# Altium schematic sheet Battery_Charger.SchDoc: Battery Charger
size Tabloid; Author: Adam Turaj; SheetNumber: 2; SheetTotal: 6
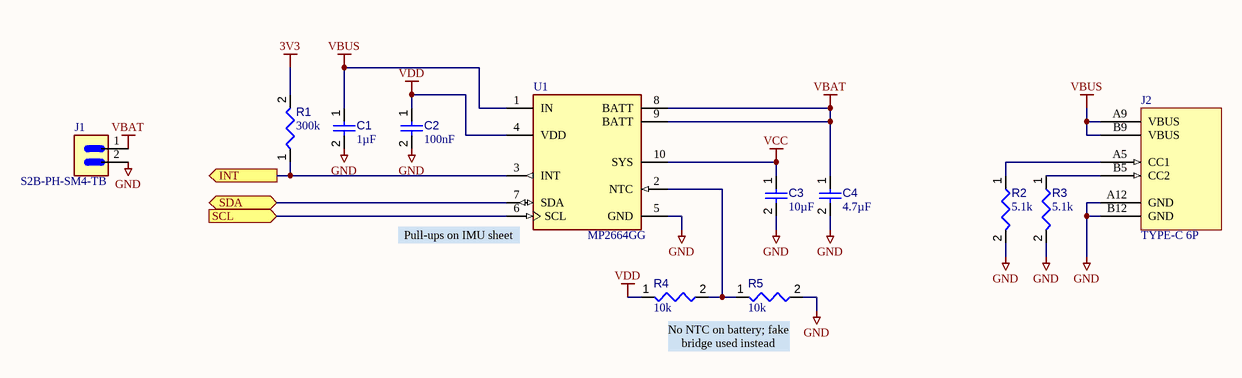
[diagram p0: Battery_Charger.SchDoc]

## Parts
C1  value 1µF  [CAPC0603(1608)100_L]  (hidden comment: Capacitor 1µF +/-40% 50V 0603)
C2  value 100nF  [CAPC1608X90X40NL10T20]  (hidden comment: Capacitor 100 nF +/-10% 50 V 0603)
C3  value 10µF  [CAPC0603(1608)100_L]  (hidden comment: Capacitor 10µF +/-20% 10V 0603)
C4  value 4.7µF  [CAPC0603(1608)100_L]  (hidden comment: Capacitor 4.7µF +/-20% 10V 0603)
J1  S2B-PH-SM4-TB  [JST_S2B-PH-SM4-TB]
J2  TYPE-C 6P  [TYPE-C 8P-Footprint-1]
R1  value 300k  [RESC1608X55X25ML10T15]  (hidden comment: Resistor 300k +/-1% 0603 100 mW)
R2  value 5.1k  [RESC1608X55X25ML10T15]  (hidden comment: Resistor 5k1 +/-1% 0603 100 mW)
R3  value 5.1k  [RESC1608X55X25ML10T15]  (hidden comment: Resistor 5k1 +/-1% 0603 100 mW)
R4  value 10k  [RESC1608X55X25ML10T15]  (hidden comment: Resistor 10k +/-1% 0603 100 mW)
R5  value 10k  [RESC1608X55X25ML10T15]  (hidden comment: Resistor 10k +/-1% 0603 100 mW)
U1  MP2664GG  [QFN50P200X200X100-10N]

## Ports
INT (out, see Root[4C]), SCL (in, see Root[4C], Display[4B], IMU[4B], MCU[5B]), SDA (bidir, see Root[4C], Display[4B], IMU[4B], MCU[5B])

## Nets
3V3: R1.2
GND: C1.2 C2.2 C3.2 C4.2 J1.2 J2.A12(GND) J2.B12(GND) R2.2 R3.2 R5.2 U1.5(GND)
VBAT: C4.1 J1.1 U1.8(BATT) U1.9(BATT)
VBUS: C1.1 J2.A9(VBUS) J2.B9(VBUS) U1.1(IN)
VCC: C3.1 U1.10(SYS)
VDD: C2.1 R4.1 U1.4(VDD)
INT: R1.1 U1.3(INT) ; port INT
SCL: U1.6(SCL) ; port SCL
SDA: U1.7(SDA) ; port SDA
NetJ2_A5: J2.A5(CC1) R2.1
NetJ2_B5: J2.B5(CC2) R3.1
NetR4_2: R4.2 R5.1 U1.2(NTC)

## Notes on the sheet
- (near U1) Pull-ups on IMU sheet
- No NTC on battery; fake bridge used instead
- Title:
- Author:
- Size:
- Date:
- Git Hash:
- Tabloid
- Prj:
- Variant:
- Edited:
- File:

## Library data of the parts
C1 = CMP-001-00078-4: Chip Capacitor, 1µF +/-40%, 50V, 0603, Thickness 1 mm; Tolerance: 10%; Case/Package: 0603; Pins: 2; Max Operating Temperature: 85°C; Voltage Rating: 50V; Mounting Technology: SMT; Min Operating Temperature: -55°C
C2 = CMP-001-00017-6: Chip Capacitor, 100 nF, +/- 10%, 50 V, 0603 (1608 Metric); Voltage Rating: 50V; Capacitor Type: Ceramic; Tolerance: 10%; Mounting Technology: SM; Max Operating Temperature: 125°C; RoHS Compliant: True; Pins: 2; Case/Package: 0603; Min Operating Temperature: -55°C
C3 = CMP-001-00075-4: Chip Capacitor, 10µF +/-20%, 10V, 0603, Thickness 1 mm; Tolerance: 10%; Voltage Rating: 10V; Max Operating Temperature: 85°C; Pins: 2; Case/Package: 0603; Mounting Technology: SMT; Min Operating Temperature: -55°C
C4 = CMP-001-00076-4: Chip Capacitor, 4.7µF +/-20%, 10V, 0603, Thickness 1 mm; Tolerance: 10%; Mounting Technology: SMT; Case/Package: 0603; Pins: 2; Min Operating Temperature: -55°C; Max Operating Temperature: 85°C; Voltage Rating: 10V
J1 = CMP-002-00072-3: Connector Header Surface Mount, Right Angle 2 position 0.079 (2.00mm); MF: JST Sales; Check_prices: https://www.snapeda.com/parts/S2B-PH-SM4-TB/JST/view-part/?ref=eda; Design Item ID: S2B-PH-SM4-TB; MP: S2B-PH-SM4-TB; Value: *; Case/Package: None; Source: S2B-PH-SM4-TB.SchLib; Component Type: Standard; Pins: 2; SnapEDA_Link: https://www.snapeda.com/parts/S2B-PH-SM4-TB/JST/view-part/?ref=snap
J2 = CMP-002-00074-2: 6P Black Female Surface Mount, Right Angle USB Type-C; Max Current Rating: 3A; Voltage Rating: 5V; Max Operating Temperature: 80°C; Mounting Technology: Right Angle; Pins: 6; Connector Type: USB; Case/Package: SMD; Gender: Female; Min Operating Temperature: -30°C
R1 = CMP-009-00178-1: Chip Resistor, 300 KOhm, +/- 1%, 0.1 W, -55 to 155 degC, 0603 (1608 Metric); Voltage Rating: 50V; Power: 100mW; Mounting Technology: SM; Tolerance: 1%; Max Operating Temperature: 155°C; RoHS Compliant: True; Pins: 2; Case/Package: 0603; Min Operating Temperature: -55°C
R2 R3 = CMP-009-00183-1: Chip Resistor, 5.1 KOhm, +/- 1%, 0.1 W, -55 to 155 degC, 0603 (1608 Metric); Power: 100mW; Voltage Rating: 50V; Min Operating Temperature: -55°C; Pins: 2; Tolerance: 1%; Case/Package: 0603; RoHS Compliant: True; Max Operating Temperature: 155°C; Mounting Technology: SM
R4 R5 = CMP-009-00017-5: Chip Resistor, 10 KOhm, +/- 1%, 01 W, -55 to 155 degC, 0603 (1608 Metric); Voltage Rating: 50V; Power: 100mW; RoHS Compliant: True; Min Operating Temperature: -55°C; Pins: 2; Case/Package: 0603; Mounting Technology: SM; Max Operating Temperature: 155°C; Tolerance: 1%
U1 = CMP-00029-00001-2: Battery Management 500mA 5V USB I2C Controlled Battery Charger; MF: Monolithic Power Systems (MPS); Component Type: Standard; SnapEDA_Link: https://www.snapeda.com/parts/MP2664GG-0000-Z/Monolithic+Power+Systems/view-part/?ref=snap; Source: MP2664GG-0000-Z.SchLib; Case/Package: None; Pins: 10; Check_prices: https://www.snapeda.com/parts/MP2664GG-0000-Z/Monolithic+Power+Systems/view-part/?ref=eda; MP: MP2664GG-0000-Z; Design Item ID: MP2664GG-0000-Z; Value: *